# Altium schematic sheet test_points.SchDoc
size A4; SheetNumber: 6; SheetTotal: 8
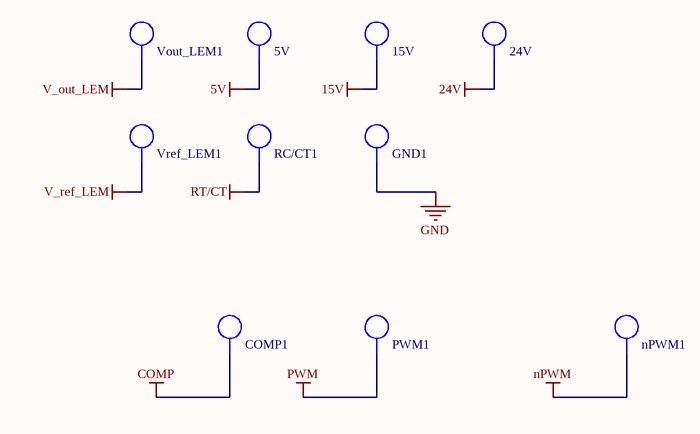
[diagram p0: test_points.SchDoc]

## Parts
5V  TP  [TP_1206]  (value not drawn)  (no BOM)
15V  TP  [TP_1206]  (value not drawn)  (no BOM)
24V  TP  [TP_1206]  (value not drawn)  (no BOM)
COMP1  TP  [TP_1206]  (value not drawn)  (no BOM)
GND1  TP  [TP_1206]  (value not drawn)  (no BOM)
nPWM1  TP  [TP_1206]  (value not drawn)  (no BOM)
PWM1  TP  [TP_1206]  (value not drawn)  (no BOM)
RC/CT1  TP  [TP_1206]  (value not drawn)  (no BOM)
Vout_LEM1  TP  [TP_1206]  (value not drawn)  (no BOM)
Vref_LEM1  TP  [TP_1206]  (value not drawn)  (no BOM)

## Nets
5V: 5V.1
15V: 15V.1
24V: 24V.1
COMP: COMP1.1
GND: GND1.1
nPWM: nPWM1.1
PWM: PWM1.1
RT/CT: RC/CT1.1
V_out_LEM: Vout_LEM1.1
V_ref_LEM: Vref_LEM1.1

## Library data of the parts
5V 15V 24V COMP1 GND1 nPWM1 PWM1 RC/CT1 Vout_LEM1 Vref_LEM1 = TP_1206: Test-Point 3.3x1.6x2.1mm SMD; Manufacturer: Harwin Inc; Manufacturer Part Number: S1751-46R; Manufacturer PN: *; Storage Location: ProtoPlace; Mounting Type: Surface Mount; Type: PC Test Point; Supplier 1: Digi-Key; Supplier Part Number 1: 952-1478-2-ND; Supplier 2: Farnell; Supplier Part Number 2: 1826282; Supplier: ECE Dept; Value: TP